# EAGLE design Pottery Wheel  V_1_1_9 (EAGLE 9.6.2)
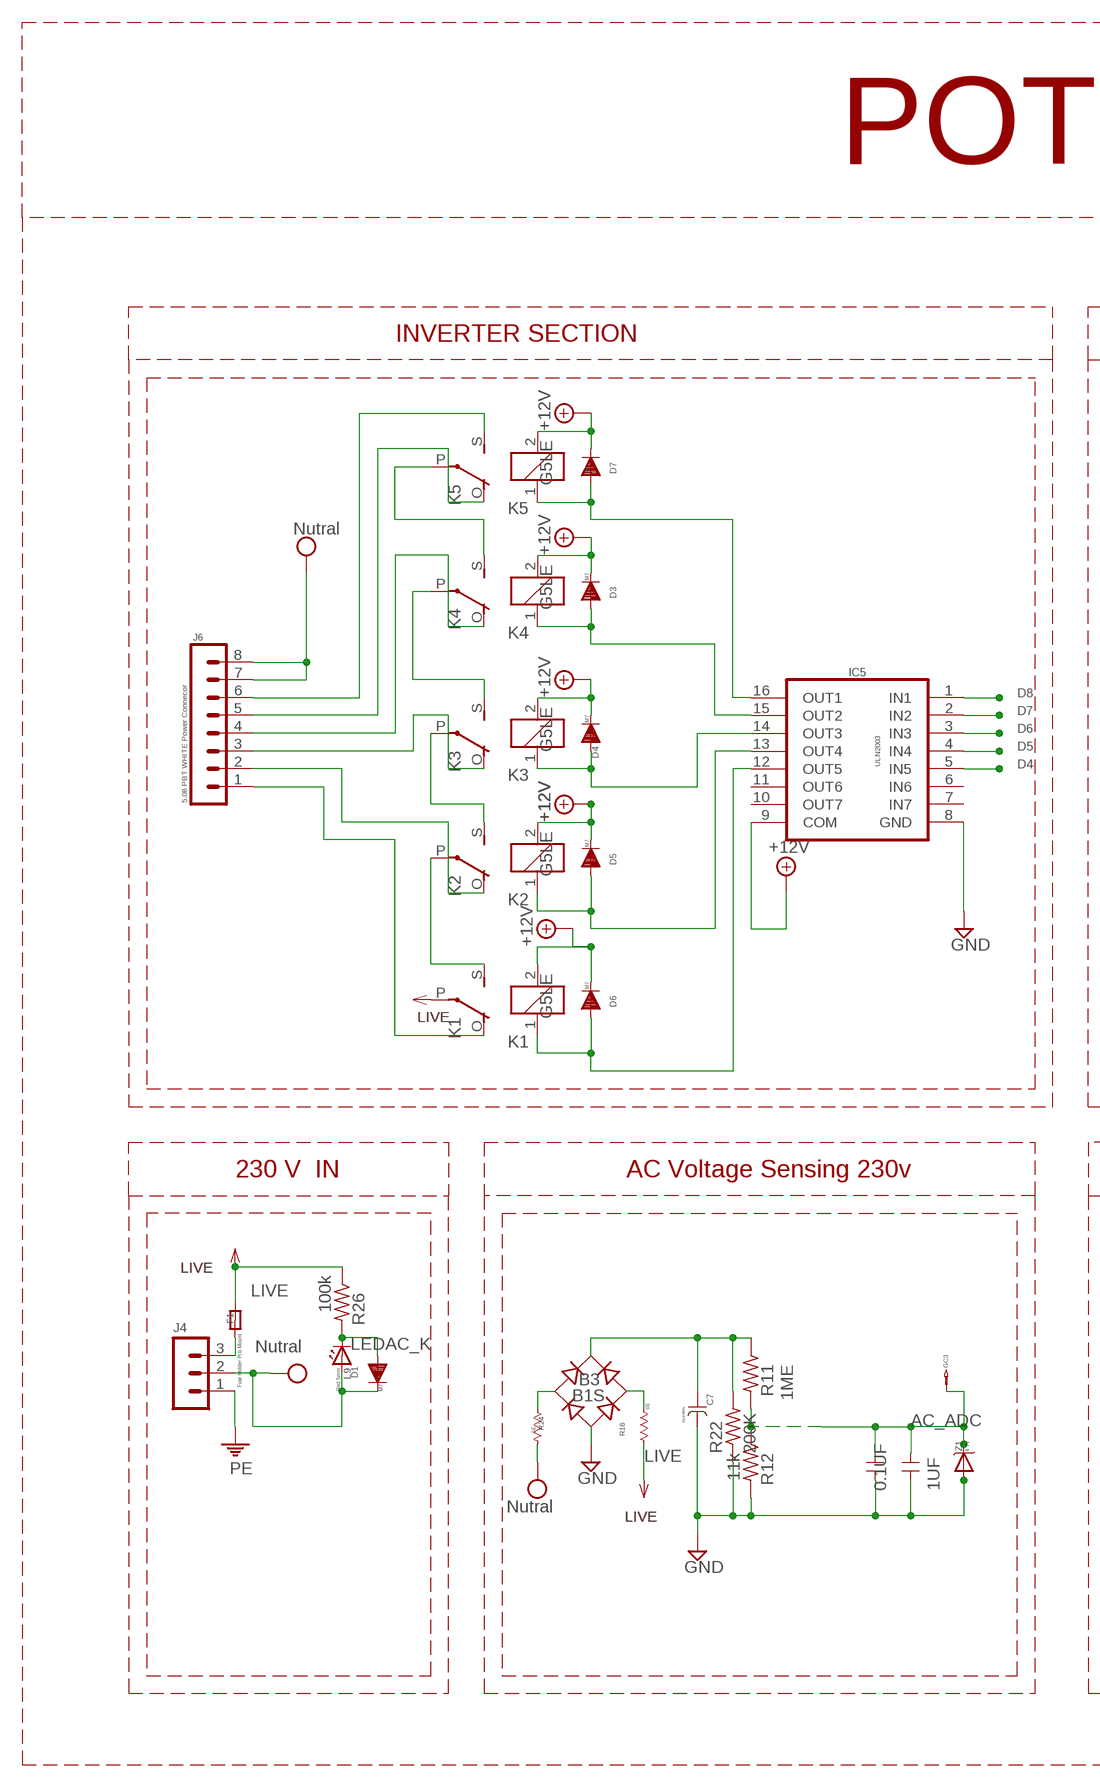
[diagram p0: schematic, sheet 1, part 1 of 2]
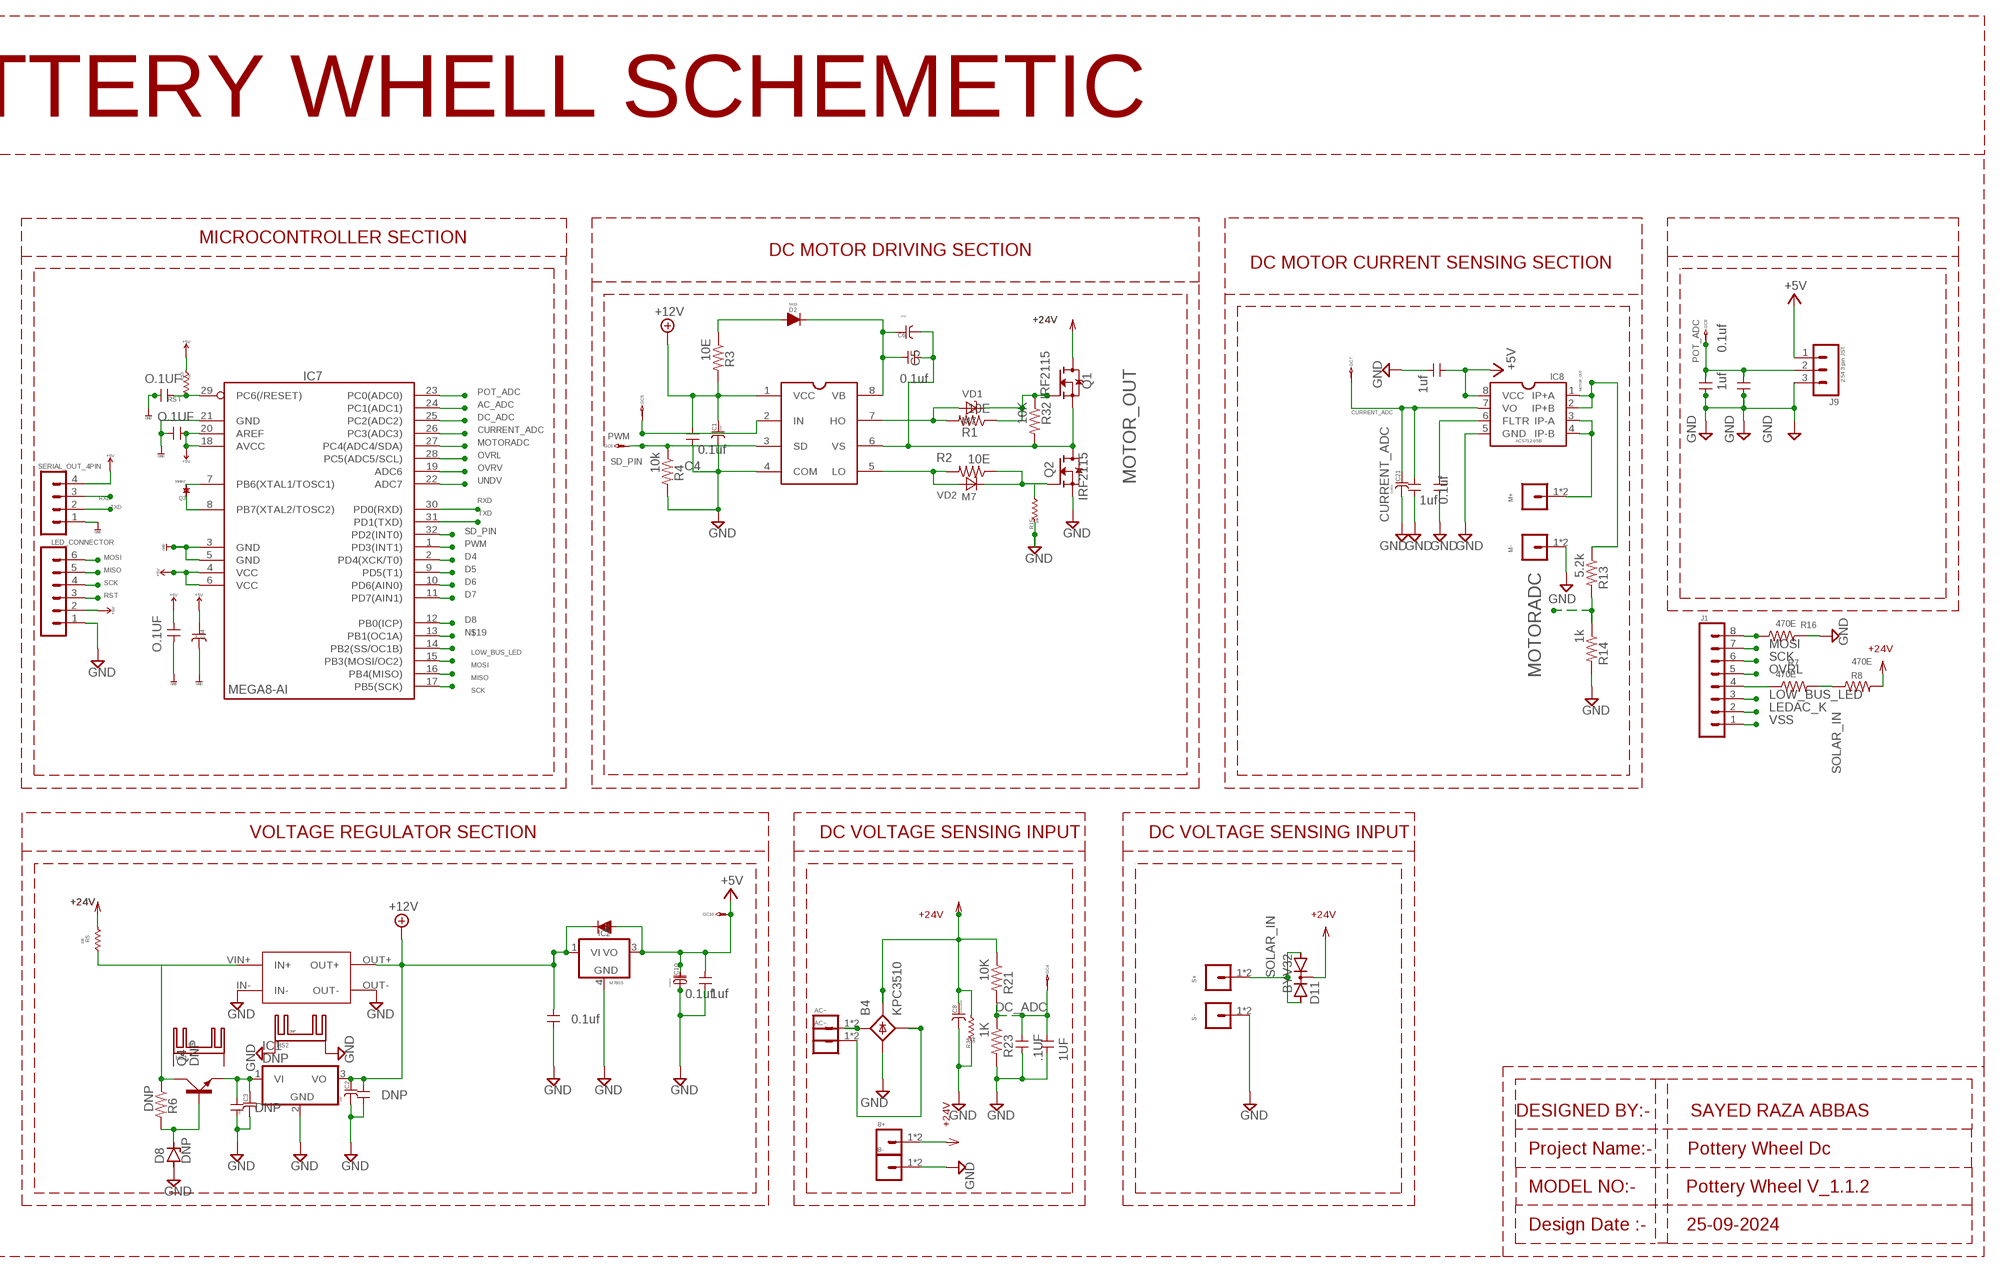
[diagram p1: schematic, sheet 1, part 2 of 2]

## Parts
AC~  JST_1-PINBARR  [1-PIN_9.6]
AC~.  JST_1-PINBARR  [1-PIN_9.6]
B3  B1S  [MBS]
B4  KPC3510  B25A-  [B25A-]
B+  JST_1-PINBARR  [1-PIN_9.6]
B-  JST_1-PINBARR  [1-PIN_9.6]
C1  10uf  CAP_ELE6_V  [C_6_V]
C2  DNP  CAP_ELE8_V  [C_8_V]
C3  DNP  CAP_ELE8_V  [C_8_V]
C4  0.1uf  C-USC1206  [C1206]
C5  0.1uf  C-USC1206  [C1206]
C6  10uf  CAP_ELE6_V  [C_6_V]
C7  10uf/450v  CAP_ELE8_V  [C_8_V]
C8  4700uf/50V  CAP_ELE19MM  [C_19MM]
C9  1uf  C-USC1206  [C1206]
C10  10uf/63v  CAP_ELE8_V  [C_8_V]
C11  DNP  C-USC1206  [C1206]
C12  DNP  C-USC1206  [C1206]
C13  0.1uf  C-USC1206  [C1206]
C15  0.1uf  C-USC1206  [C1206]
C16  1uf  C-USC1206  [C1206]
C17  0.1uf  C-USC1206  [C1206]
C18  1uf  C-USC1206  [C1206]
C20  1uf  C-USC1206  [C1206]
C21  10uf/63v  CAP_ELE5_V  [C_5_V]
C22  .1UF  C-USC1206  [C1206]
C23  1UF  C-USC1206  [C1206]
C24  0.1UF  C-USC1206  [C1206]
C25  1UF  C-USC1206  [C1206]
C28  O.1UF  C-USC1206  [C1206]
C29  O.1UF  C-USC1206  [C1206]
C30  O.1UF  C-USC1206  [C1206]
C34  DNP  CAP_TANTA  [TANT_1206]
C36  0.1uf  C-USC1206  [C1206]
D1  M7  DIODE  [SMB]
D2  5819  DIODE80  [SOD-80]
D3  M7  DIODE  [SMB]
D4  M7  DIODE  [SMB]
D5  M7  DIODE  [SMB]
D6  M7  DIODE  [SMB]
D7  M7  DIODE  [SMB]
D8  DNP  ZENER-DIODEZD-12.5  [ZDIO12.5]
D9  M7  DIODE  [SMB]
D11  BYV32  [TO220ABS]
F1  Fuse Holder Pcb Mount  FUSEBOX  [FH_BOX]
GC3  PTR1PAD1-17Y  [P1-17Y]
GC4  PTR1PAD1-17Y  [P1-17Y]
GC5  PTR1PAD1-17Y  [P1-17Y]
GC6  PTR1PAD1-17Y  [P1-17Y]
GC7  PTR1PAD1-17Y  [P1-17Y]
GC8  PTR1PAD1-17Y  [P1-17Y]
GC10  PTR1PAD1-17Y  [P1-17Y]
HS1  DNP  HEATSINKPI-49  [PI-49]
HS2  DNP  HEATSINKPI-49  [PI-49]
IC1  DNP  786TV  [TO220V]
IC2  M7805  78XXDPAK  [DPAK]
IC5  ULN2003  ULN2003SO  [SOIC-16]
IC7  MEGA8-AI  [TQFP32-08]
IC8  ACS712-05B  ACS712-20TSOIC  [SO-08]
J1  JST_8-PINM  [MOLEX_8-PIN]
J4  JST_3-PIN7.62  [3-PIN_7.62]
J6  5.08 PBT WHITE Power Connecor  JST_8-PIN5.08  [8-PIN_5.08_PWR]
J9  2.54 3 pin JST  JST_3-PINM  [MOLEX_3-PIN]
K1  G5LE  [G5LE]
K2  G5LE  [G5LE]
K3  G5LE  [G5LE]
K4  G5LE  [G5LE]
K5  G5LE  [G5LE]
L9  Red 5mm  LED5MM  [LED_5MM]
LED_CONNECTOR  JST_6-PINM  [MOLEX_6-PIN]
M+  JST_1-PINBARR  [1-PIN_9.6]
M-  JST_1-PINBARR  [1-PIN_9.6]
Q1  IRF2115  IRF5210  [TO254P1054X469X2933-3]
Q2  IRF2115  IRF5210  [TO254P1054X469X2933-3]
Q3  16MHZ  CRYSTALHC49S  [HC49/S]
Q4  DNP  TIP41C  [TO220AV]
R1  10E  R-US_M1206  [M1206]
R2  10E  R-US_M1206  [M1206]
R3  10E  R-US_M1206  [M1206]
R4  10k  R-US_M1206  [M1206]
R5  10E  RESISTOR2L  [RES_2W_L]
R6  DNP  R-US_M1206  [M1206]
R7  470E  R-US_M1206  [M1206]
R8  470E  R-US_M1206  [M1206]
R11  1ME  R-US_M1206  [M1206]
R12  11k  R-US_M1206  [M1206]
R13  5.2k  R-US_M1206  [M1206]
R14  1k  R-US_M1206  [M1206]
R15  10K  RESISTORM1  [1206]
R16  470E  R-US_M1206  [M1206]
R18  0E  RESISTOR2V  [2W]
R21  10K  R-US_M1206  [M1206]
R22  200K  R-US_R2512  [R2512]
R23  1K  R-US_M1206  [M1206]
R24  0E  RESISTOR2V  [2W]
R26  100k  R-US_M1206  [M1206]
R32  10K  R-US_M1206  [M1206]
R34  DNP  RESISTORM1  [1206]
R53  10K  RESISTORM  [0805]
S+  JST_1-PINBARR  [1-PIN_9.6]
S-  JST_1-PINBARR  [1-PIN_9.6]
SERIAL_OUT_4PIN  JST_4-PINM  [MOLEX_4-PIN]
U$1  IR2104S  [IR2104S]
U$3  XL7015  [XL7015]
VD1  M7  DIODE-TVS-UNIDIR-SMB  [SMB]
VD2  M7  DIODE-TVS-UNIDIR-SMB  [SMB]
Z1  4.7V  Z_DIODE  [SMB_Z]

## Nets
+5V: C10.+ C16.1 C17.1 C18.1 C28.2 C30.2 C34.+ D9.A GC10.TP IC2.3(VO) IC7.4(VCC) IC7.6(VCC) IC7.18(AVCC) IC7.20(AREF) IC8.8(VCC) J9.1 LED_CONNECTOR.2 R53.2 SERIAL_OUT_4PIN.4
+12V: C1.+ C2.+ C4.1 C11.1 C13.1 D3.K D4.K D5.K D6.K D7.K D9.K IC1.3(VO) IC2.1(VI) IC5.9(COM) K1.2 K2.2 K3.2 K4.2 K5.2 R3.2 U$1.1(VCC) U$3.OUT+
+24V: B4.+ B4.+1(+) B+.1 B+.2 C8.1(+) D11.C Q1.DRAIN R5.1 R8.2 R21.1 R34.2
AC_ADC: C24.1 C25.1 GC3.TP IC7.24(PC1(ADC1)) R11.2 R12.1 Z1.K
CURRENT_ADC: C20.1 C21.+ GC7.TP IC7.26(PC3(ADC3)) IC8.7(VO)
D4: IC5.5(IN5) IC7.2(PD4(XCK/T0))
D5: IC5.4(IN4) IC7.9(PD5(T1))
D6: IC5.3(IN3) IC7.10(PD6(AIN0))
D7: IC5.2(IN2) IC7.11(PD7(AIN1))
D8: IC5.1(IN1) IC7.12(PB0(ICP))
DC_ADC: C22.1 C23.1 GC4.TP IC7.25(PC2(ADC2)) R21.2 R23.1
GND: B3.- B4.- B4.-1(-) B-.1 B-.2 C1.- C2.- C3.- C4.2 C7.- C8.2(-) C9.2 C10.- C11.2 C12.2 C13.2 C15.2 C16.2 C17.2 C18.2 C20.2 C21.- C22.2 C23.2 C24.2 C25.2 C28.1 C29.1 C30.1 C34.- C36.2 D8.A HS2.1 HS2.2 IC1.2(GND) IC2.4(GND) IC5.8(GND) IC7.3(GND) IC7.5(GND) IC7.21(GND) IC8.5(GND) J9.3 LED_CONNECTOR.1 M-.1 M-.2 Q2.SOURCE R4.2 R12.2 R14.2 R15.1 R16.2 R22.1 R23.2 R34.1 S-.1 S-.2 SERIAL_OUT_4PIN.1 U$1.4(COM) U$3.IN- U$3.OUT- Z1.A
LEDAC_K: D1.A J1.2 L9.K R26.2
LIVE: F1.2 K1.P(2:P) R18.1 R26.1
LOW_BUS_LED: IC7.14(PB2(SS/OC1B)) J1.3
MISO: IC7.16(PB4(MISO)) LED_CONNECTOR.5
MOSI: IC7.15(PB3(MOSI/OC2)) J1.7 LED_CONNECTOR.6
MOTOR_OUT: C5.2 C6.- IC8.1(IP+A) IC8.2(IP+B) Q1.SOURCE Q2.DRAIN R13.1 R32.2 U$1.6(VS)
MOTORADC: IC7.27(PC4(ADC4/SDA)) R13.2 R14.1
N$1: R1.2 U$1.7(HO) VD1.A
N$2: R2.2 U$1.5(LO) VD2.A
N$3: Q2.GAET(GATE) R2.1 R15.2 VD2.C
N$4: Q4.C R5.2 R6.1 U$3.VIN+(IN+)
N$5: AC~.1 AC~.2 B4.AC1 B4.AC1-(AC1)
N$6: Q1.GAET(GATE) R1.1 R32.1 VD1.C
N$7: F1.1 J4.3
N$8: C5.1 C6.+ D2.K U$1.8(VB)
N$9: D2.A R3.1
N$10: C15.1 IC8.6(FLTR)
N$11: AC~..1 AC~..2 B4.AC2 B4.AC2-(AC2)
N$12: J6.1 K1.O(2:O)
N$13: K1.S(2:S) K2.P(2:P)
N$14: J6.2 K2.O(2:O)
N$15: K2.S(2:S) K3.P(2:P)
N$16: K3.S(2:S) K4.P(2:P)
N$17: J6.3 K3.O(2:O)
N$18: J6.4 K4.O(2:O)
N$19: IC7.13(PB1(OC1A))
N$20: D4.A IC5.14(OUT3) K3.1
N$21: C3.+ C12.1 IC1.1(VI) Q4.E
N$22: D6.A IC5.12(OUT5) K1.1
N$23: J1.4 R7.1
N$24: D8.C Q4.B R6.2
N$25: D5.A IC5.13(OUT4) K2.1
N$28: IC7.7(PB6(XTAL1/TOSC1)) Q3.2
N$29: K4.S(2:S) K5.P(2:P)
N$30: J6.5 K5.O(2:O)
N$31: J6.6 K5.S(2:S)
N$32: B3.AC1 R24.1
N$34: D3.A IC5.15(OUT2) K4.1
N$36: IC7.8(PB7(XTAL2/TOSC2)) Q3.1
N$37: D7.A IC5.16(OUT1) K5.1
N$38: B3.AC2 R18.2
N$40: B3.+ C7.+ R11.1 R22.2
N$47: IC8.3(IP-A) IC8.4(IP-B) M+.1 M+.2
N$50: J1.8 R16.1
OVRL: IC7.28(PC5(ADC5/SCL)) J1.5
OVRV: IC7.19(ADC6)
PE: J4.1
POT_ADC: C9.1 C36.1 GC8.TP IC7.23(PC0(ADC0)) J9.2
PWM: GC5.TP IC7.1(PD3(INT1)) U$1.2(IN)
RST: C29.2 IC7.29(PC6(/RESET)) LED_CONNECTOR.3 R53.1
RXD: IC7.30(PD0(RXD)) SERIAL_OUT_4PIN.3
SCK: IC7.17(PB5(SCK)) J1.6 LED_CONNECTOR.4
SD_PIN: GC6.TP IC7.32(PD2(INT0)) R4.1 U$1.3(SD)
SOLAR_IN: D11.A1 D11.A2 R7.2 R8.1 S+.1 S+.2
TXD: IC7.31(PD1(TXD)) SERIAL_OUT_4PIN.2
UNDV: IC7.22(ADC7)
VSS: D1.K J1.1 J4.2 J6.7 J6.8 L9.A R24.2 ; supply symbol labelled Nutral
Unconnected: HS1.1 HS1.2 IC5.6(IN6) IC5.7(IN7) IC5.10(OUT7) IC5.11(OUT6)

## Notes on the sheet
- POTTERY WHELL SCHEMETIC
- INVERTER SECTION | MICROCONTROLLER SECTION
- DC MOTOR DRIVING SECTION
- DC MOTOR CURRENT SENSING SECTION
- 230 V  IN | AC Voltage Sensing 230v | VOLTAGE REGULATOR SECTION | DC VOLTAGE SENSING INPUT | DC VOLTAGE SENSING INPUT
- DESIGNED BY:-        SAYED RAZA ABBAS
- Project Name:-       Pottery Wheel Dc
- MODEL NO:-          Pottery Wheel V_1.1.2
- Design Date :-        25-09-2024

## Library data of the parts
AC~ AC~. B+ B- M+ M- S+ S- = Squadron:JST_1-PIN
B3 = rectifier:B*S: Surface Mount Glass Passivated Bridge Rectifiers Source: Comchip Bridge Rectifiers B05S-G_B10S-G.pdf
B4 = rectifier:B25A-: RECTIFIER 25-A bridge
C1-C3 C6-C8 C10 C21 = Squadron:CAP_ELE
C4 C5 C9 C11-C13 C15-C18 C20 C22-C25 C28-C30 C36 = rcl:C-US: CAPACITOR, American symbol; SPICEPREFIX: C
C34 = Squadron:CAP_TANT
D1-D7 D9 = Squadron:DIODE
D8 = diode:ZENER-DIODE: Z-Diode
D11 = diode:BYV32: DIODE 2 x Si diode 200 V, 20 A/230 Apeak, 25 ns
F1 = Squadron:FUSE
GC3-GC8 GC10 = testpad:PTR1: TEST PIN
HS1 HS2 = Squadron:HEATSINK
IC1 = linear:78*: Positive VOLTAGE REGULATOR Source: http://cache.national.com/ds/LM/LM78L05.pdf http://www.fairchildsemi.com/ds/LM/LM7805.pdf
IC2 = Squadron:78XX
IC5 = Squadron:ULN2003
IC7 = atmel:MEGA8: MICROCONTROLLER 8 Kbytes FLASH, 1 kbytes SRAM, 512 bytes EEPROM, USART, 6-channel 10 bit ADC, 2-channel 8 bit ADC Pin compatible with Atmega48, ATMega88, ATMega168 Source: avr.lbr; MPN: ATMEGA8-16AU; OC_FARNELL: 9171371; OC_NEWARK: 73M8863
IC8 = R_Sol:ACS712-20T
J1 J6 = Squadron:JST_8-PIN
J4 J9 = Squadron:JST_3-PIN
K1-K5 = relay:G5LE: RELAY 1 x switch, 10 A/120 V AC, 8 A/30 V DC, Omron
L9 = Squadron:LED
LED_CONNECTOR = Squadron:JST_6-PIN
Q1 Q2 = IRFB4110:IRF5210: Check availability <https://pricing.snapeda.com/parts/IRF5210/Infineon%20Technologies/view-part?ref=eda>; AVAILABILITY: In Stock; CHECK_PRICES: https://www.snapeda.com/parts/IRF5210/Infineon+Technologies/view-part/?ref=eda; DESCRIPTION: P-Channel 100 V 38A (Tc) 3.1W (Ta), 170W (Tc) Through Hole TO-262; MF: Infineon Technologies; MP: IRF5210; PACKAGE: TO-220 Infineon; PRICE: None; SNAPEDA_LINK: https://www.snapeda.com/parts/IRF5210/Infineon+Technologies/view-part/?ref=snap
Q3 = crystal:CRYSTAL: CRYSTAL; OC_FARNELL: 1667008; OC_NEWARK: unknown
Q4 = transistor-power:TIP41C: NPN TRANSISTOR
R1-R4 R6-R8 R11-R14 R16 R21-R23 R26 R32 = rcl:R-US_: RESISTOR, American symbol; SPICEPREFIX: R
R5 R15 R18 R24 R34 R53 = Squadron:RESISTOR
SERIAL_OUT_4PIN = Squadron:JST_4-PIN
U$1 = IR2104S:IR2104S: Half Bridge Mosfet - IGBT driver SOIC Check availability <https://pricing.snapeda.com/parts/IR2104S/Infineon%20Technologies/view-part?ref=eda>; AVAILABILITY: In Stock; CHECK_PRICES: https://www.snapeda.com/parts/IR2104S/Infineon+Technologies/view-part/?ref=eda; DESCRIPTION: Half-Bridge Gate Driver IC Non-Inverting 8-SOIC; MF: Infineon Technologies; MP: IR2104S; PACKAGE: SO-8 Infineon; PRICE: None; PURCHASE-URL: https://www.snapeda.com/api/url_track_click_mouser/?unipart_id=582439&manufacturer=Infineon Technologies&part_name=IR2104S&search_term=None; SNAPEDA_LINK: https://www.snapeda.com/parts/IR2104S/Infineon+Technologies/view-part/?ref=snap
U$3 = Squadron:XL7015
VD1 VD2 = diode:DIODE-TVS-UNIDIR-
Z1 = Squadron:Z_DIODE

## Board
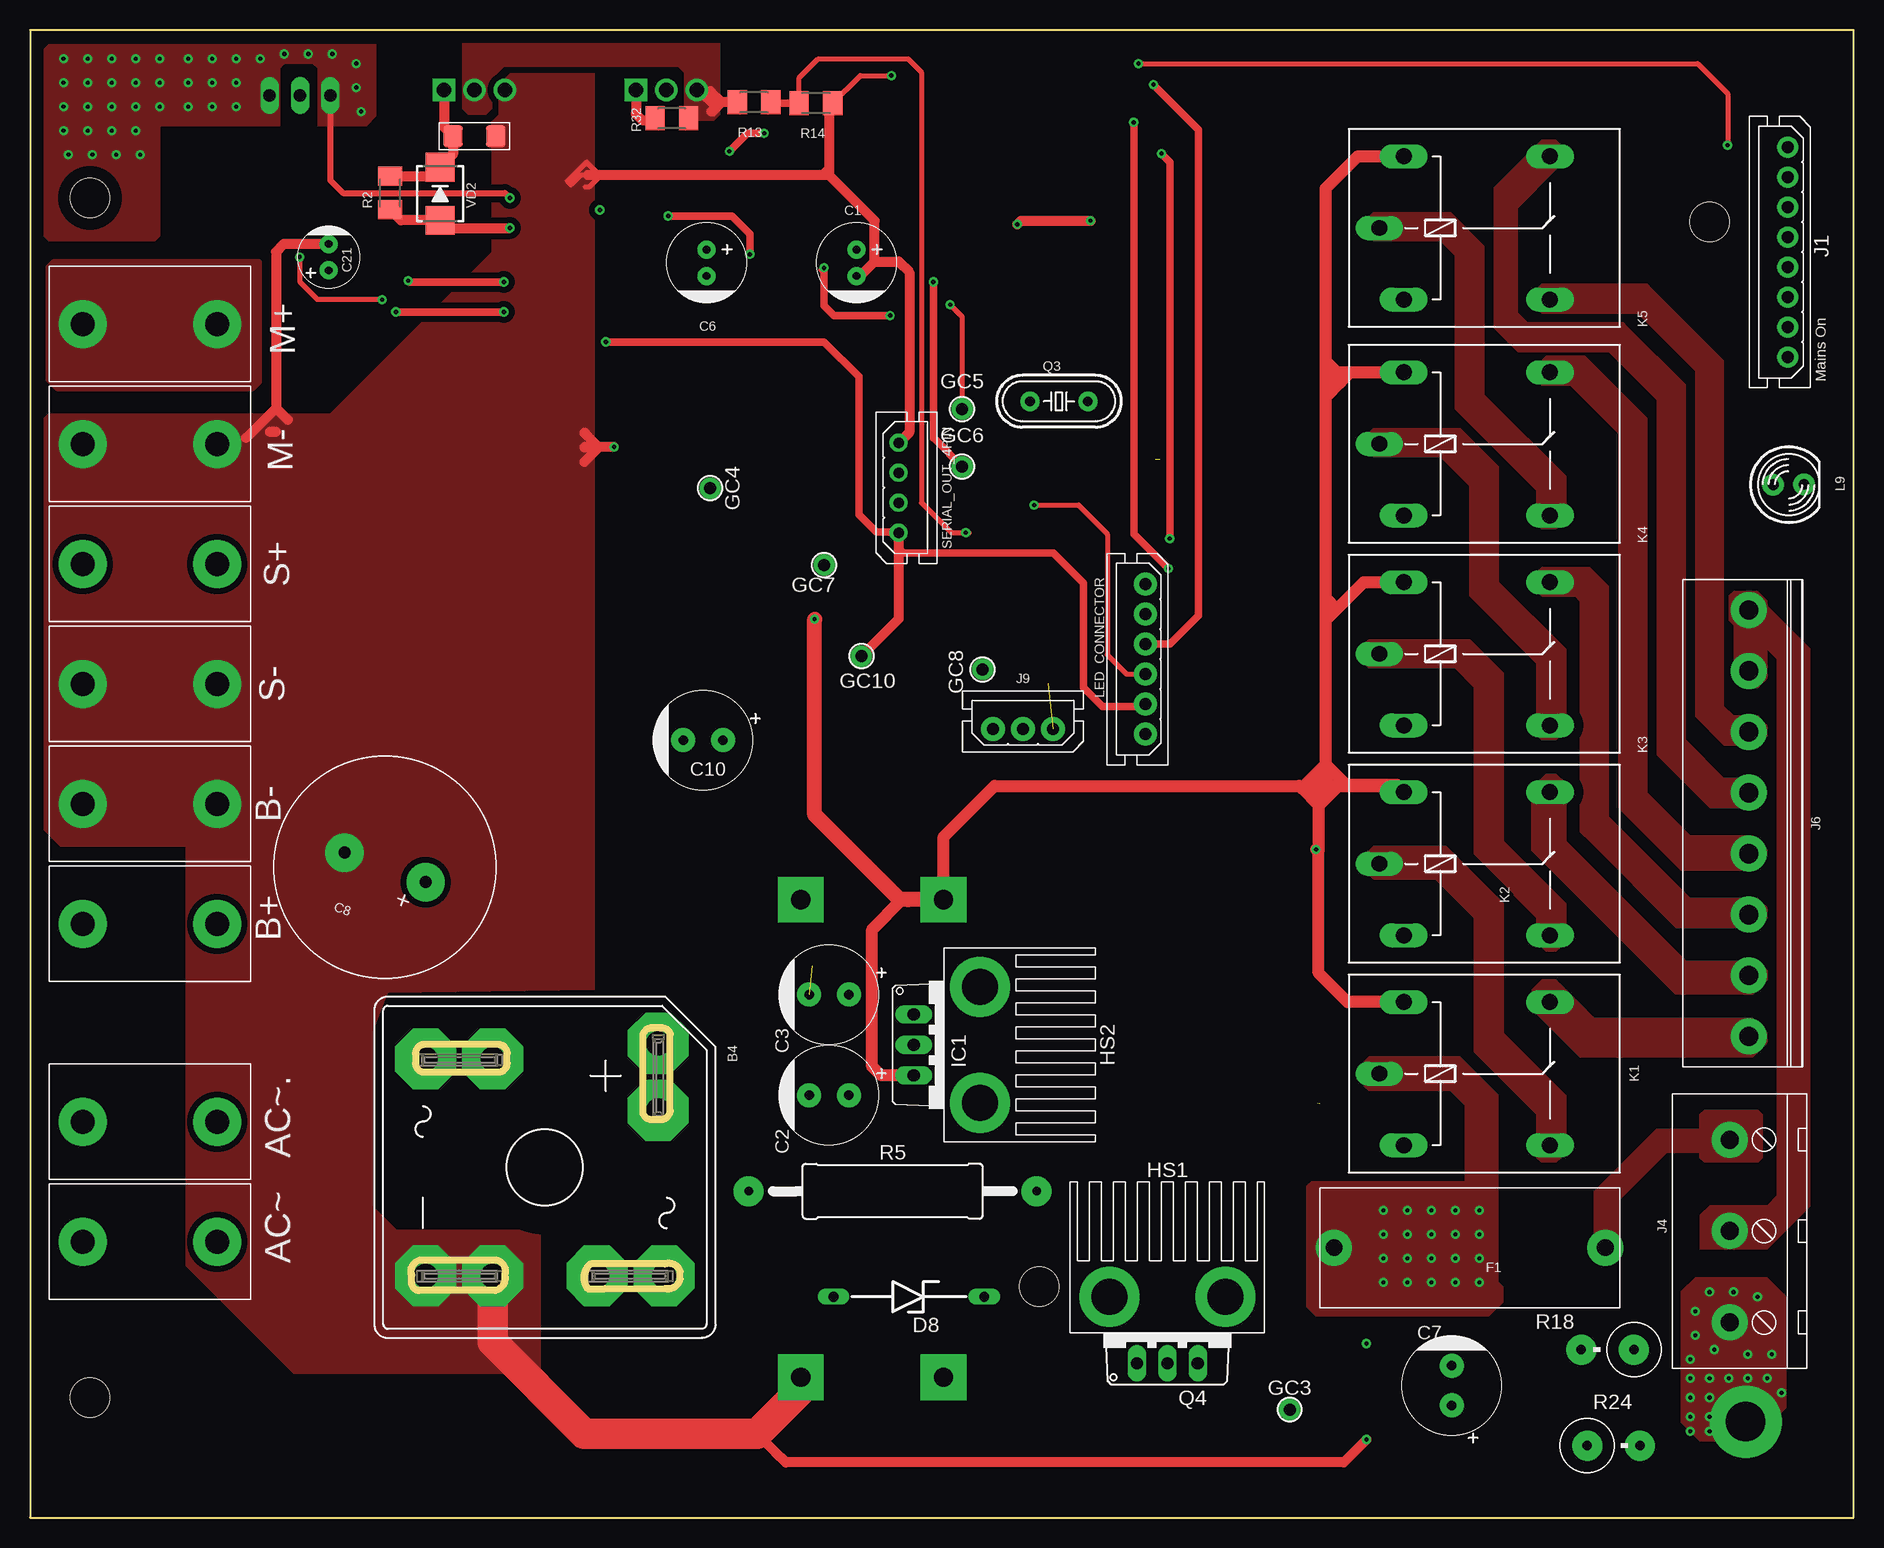
[diagram p2: board, top side]
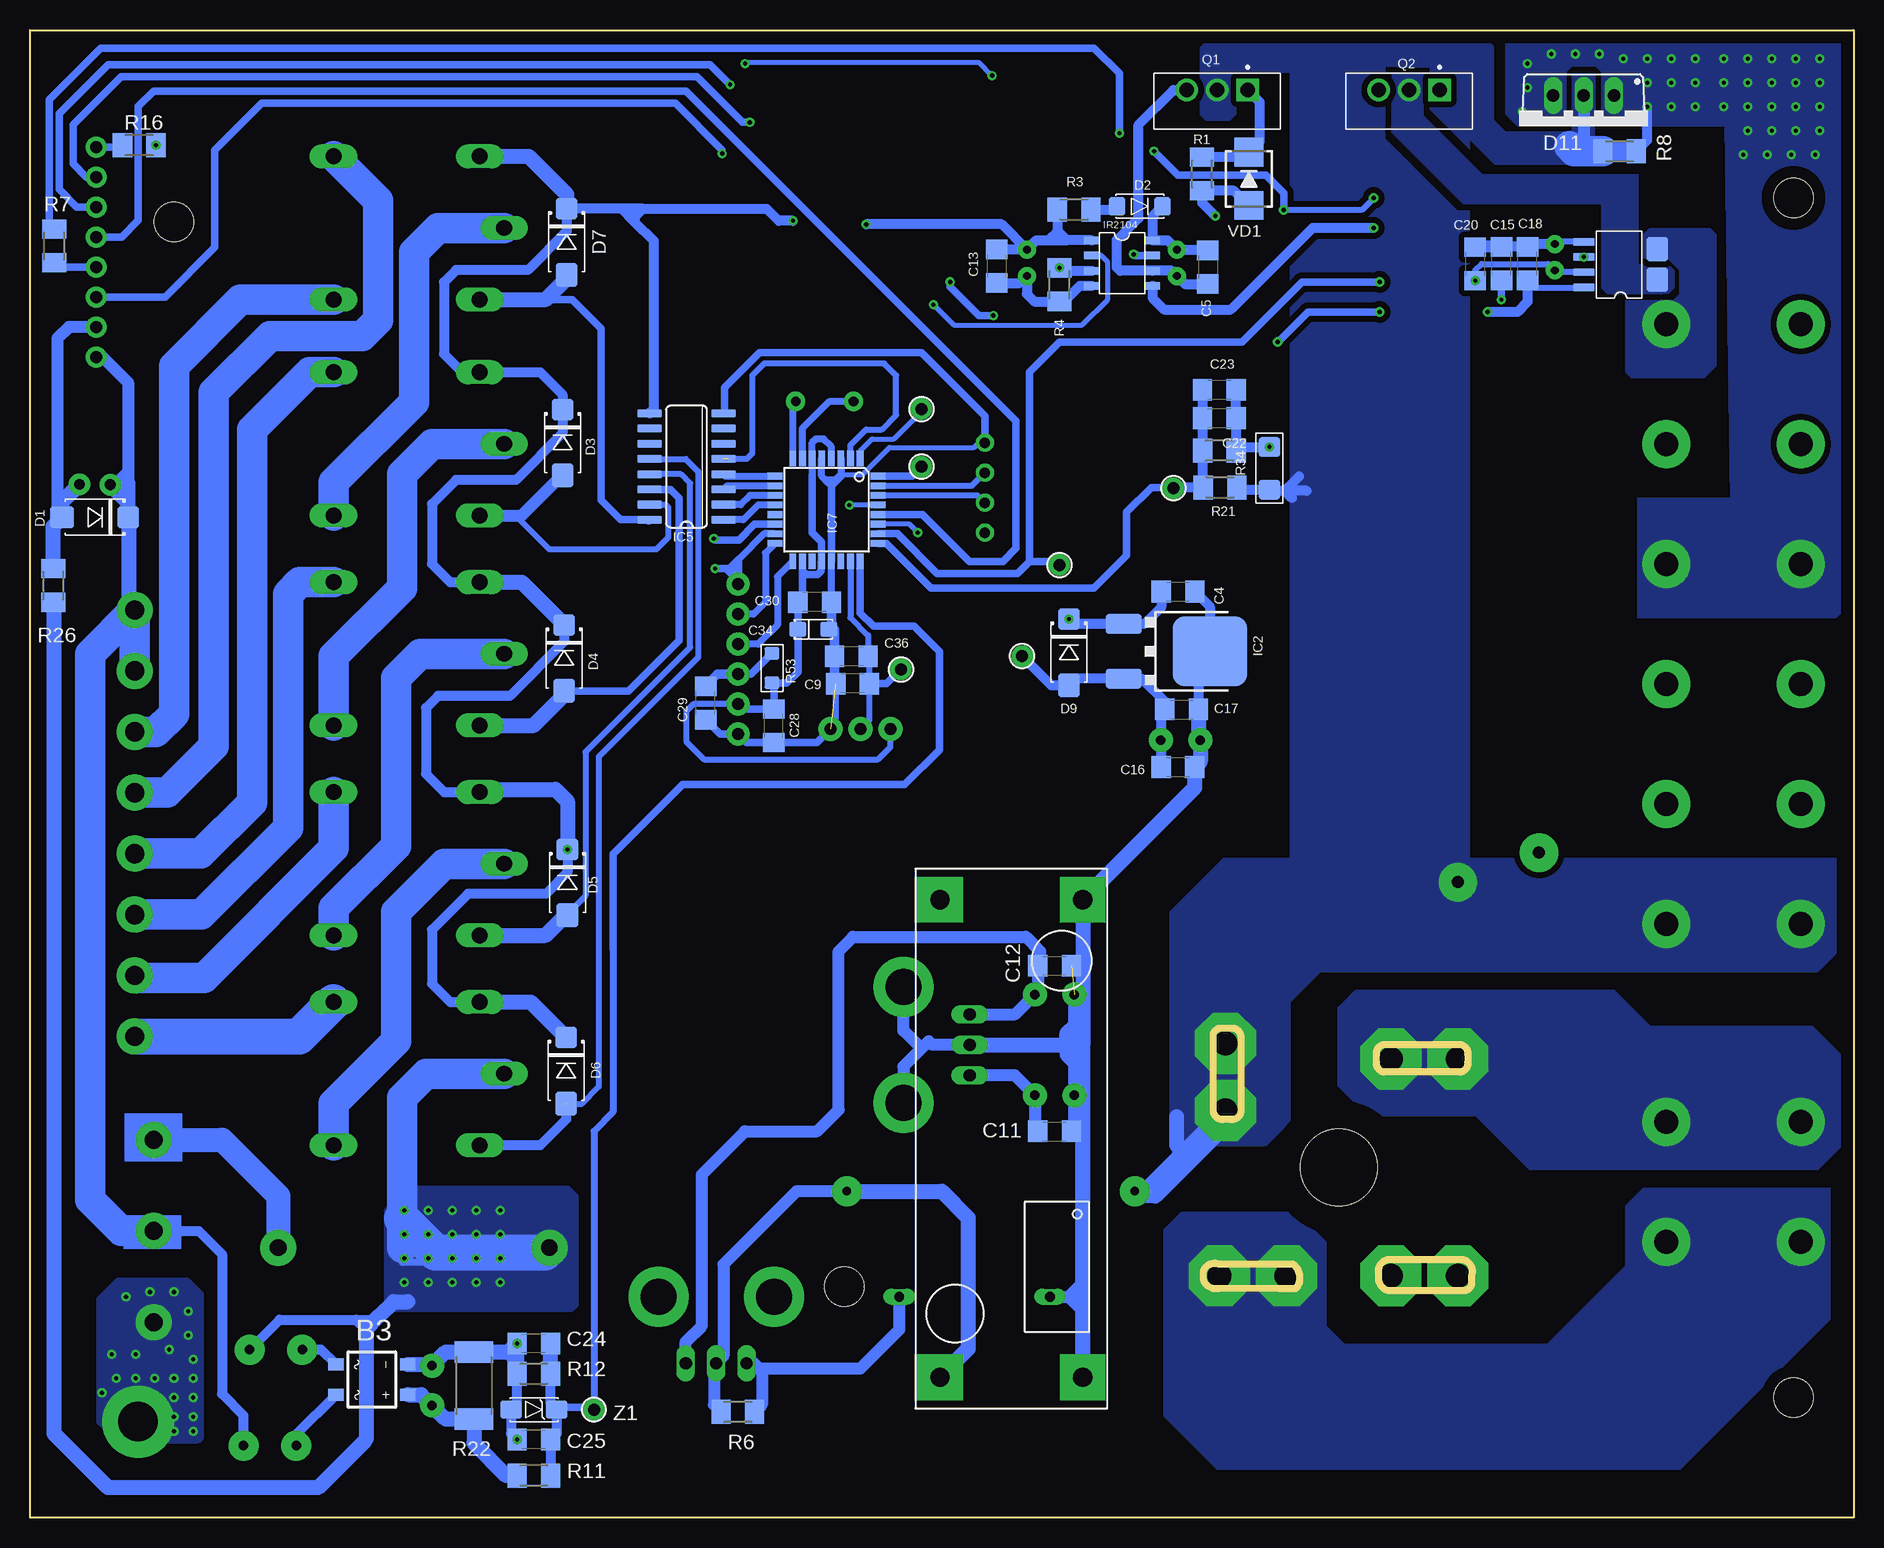
[diagram p3: board, bottom side, seen from below]

Size 152 x 124 mm. Coordinates in mm from the lower left corner, seen from the top.
Outline: 152,124 0,124 0,0 152,0 152,124
Copper layers (1*16): Top 0.035mm / dielectric 1.5mm / Bottom 0.035mm
Design rules "default *": minimum track width 6mil, minimum drill 0.35mm, track to track 6mil, track to pad 6mil, pad to pad 6mil, via to via 6mil, smd to smd 6mil, copper to edge 40mil, drill to drill 6mil, minimum pad ring 10mil, minimum via ring 8mil, stop-mask expansion 4mil, vias tented up to drill 0mil, thermal gap 10mil
Holes 3.3 mm at 84.12,19.25 5,10 5,110 140,108
Milling: 30 lines

### Footprints (pad centres in the part's own frame; a part is rotated, then mirrored left to right if it is on the bottom)
1-PIN_9.6 = drill 2 pad 4: 1 0,5.6; 2 0,-5.6
MBS = smd 1 x 1.3: + -1.27,-3; - 1.27,-3; AC1 -1.27,3; AC2 1.27,3
B25A- = drill 2.007 pad 5.08 octagon: + -10.338,9.449; +1 -4.75,9.449; - 9.042,-4.343; -1 9.042,-9.931; AC1 9.042,4.343; AC1- 9.042,9.931; AC2 -9.042,-4.343; AC2- -9.042,-9.931 | hole 6.401: 0,0
C_6_V = drill 0.65 pad 1.5: + -1.1,0; - 1.1,0
C_8_V = drill 0.8 pad 2: + -1.65,0; - 1.65,0
C1206 = smd 1.6 x 1.8: 1 -1.4,0; 2 1.4,0
C_19MM = drill 1 pad 3.2: 1 -3.6,0; 2 3.6,0
C_5_V = drill 0.65 pad 1.5: + -1.1,0; - 1.1,0
TANT_1206 = smd 1.4 x 1.2: + -1.3,0; - 1.3,0
SMB = smd 2 x 1.8: A 2.75,0 | smd 1.8 x 1.8: K -2.75,0
SOD-80 = smd 1.4 x 1.5: A -1.9,0; K 1.9,0
ZDIO12.5 = drill 0.813 long: A 6.223,0; C -6.35,0
TO220ABS = drill 1.016 long: A1 -2.54,-2.54; A2 2.54,-2.54; C 0,-2.54
FH_BOX = drill 1.4 pad 3: 1 -11.3,0; 2 11.3,0
P1-17Y = drill 1 pad 1.8: TP 0,0
PI-49 = drill 3 pad 5: 1 -4.825,3; 2 4.825,3
TO220V = drill 1.016 long: 1 -2.54,-2.54; 2 0,-2.54; 3 2.54,-2.54
DPAK = smd 1.6 x 3: 1 -2.28,-6.07; 3 2.28,-6.07 | smd 5.8 x 6.2: 4 0,1.11
SOIC-16 = smd 0.66 x 2.032: 1 -4.445,-3.073; 2 -3.175,-3.073; 3 -1.905,-3.073; 4 -0.635,-3.073; 5 0.635,-3.073; 6 1.905,-3.073; 7 3.175,-3.073; 8 4.445,-3.073; 9 4.445,3.073; 10 3.175,3.073; 11 1.905,3.073; 12 0.635,3.073; 13 -0.635,3.073; 14 -1.905,3.073; 15 -3.175,3.073; 16 -4.445,3.073
TQFP32-08 = smd 1.27 x 0.559: 1 -4.293,2.8; 2 -4.293,2; 3 -4.293,1.2; 4 -4.293,0.4; 5 -4.293,-0.4; 6 -4.293,-1.2; 7 -4.293,-2; 8 -4.293,-2.8; 17 4.293,-2.8; 18 4.293,-2; 19 4.293,-1.2; 20 4.293,-0.4; 21 4.293,0.4; 22 4.293,1.2; 23 4.293,2; 24 4.293,2.8 | smd 0.559 x 1.27: 9 -2.8,-4.293; 10 -2,-4.293; 11 -1.2,-4.293; 12 -0.4,-4.293; 13 0.4,-4.293; 14 1.2,-4.293; 15 2,-4.293; 16 2.8,-4.293; 25 2.8,4.293; 26 2,4.293; 27 1.2,4.293; 28 0.4,4.293; 29 -0.4,4.293; 30 -1.2,4.293; 31 -2,4.293; 32 -2.8,4.293
SO-08 = smd 2.032 x 1.778: 1 -1.27,-3.073; 3 1.27,-3.073 | smd 0.254 x 0.254: 2 -1.651,-3.073; 4 1.651,-3.073 | smd 0.635 x 1.778: 5 1.905,3.073; 6 0.635,3.073; 7 -0.635,3.073; 8 -1.905,3.073
MOLEX_8-PIN = drill 1 pad 1.75: 1 8.75,0; 2 6.25,0; 3 3.75,0; 4 1.25,0; 5 -1.25,0; 6 -3.75,0; 7 -6.25,0; 8 -8.75,0
3-PIN_7.62 = drill 1.5 pad 3: 1 -7.62,0; 2 0,0; 3 7.62,0
8-PIN_5.08_PWR = drill 1.6 pad 3: 1 17.78,5.5; 2 12.7,5.5; 3 7.62,5.5; 4 2.54,5.5; 5 -2.54,5.5; 6 -7.62,5.5; 7 -12.7,5.5; 8 -17.78,5.5
MOLEX_3-PIN = drill 1 pad 2: 1 2.5,0; 2 0,0; 3 -2.5,0
G5LE = drill 1.321 long: 1 -7.493,-5.969; 2 -7.493,5.969; O 4.699,5.969; P -9.525,0; S 4.699,-5.969
LED_5MM = drill 0.9 pad 1.8: A 0,-1.295; K -0.025,1.27
MOLEX_6-PIN = drill 1 pad 1.93: 1 6.25,0; 2 3.75,0; 3 1.25,0; 4 -1.25,0; 5 -3.75,0; 6 -6.25,0
TO254P1054X469X2933-3 = drill 1.23 pad 1.85: DRAIN 2.54,0; SOURCE 5.08,0 | drill 1.23 pad 1.85 square: GAET 0,0
HC49/S = drill 0.8 pad 1.6: 1 -2.413,0; 2 2.413,0
TO220AV = drill 1.016 long: B -2.54,-2.54; C 0,-2.54; E 2.54,-2.54
M1206 = smd 1.6 x 2: 1 -1.4,0; 2 1.4,0
RES_2W_L = drill 0.7 pad 2.5: 1 -12,0; 2 12,0
1206 = smd 1.6 x 1.8: 1 -1.781,0; 2 1.781,0
2W = drill 0.8 pad 2.5: 1 -2.2,0; 2 2.2,0
R2512 = smd 1.8 x 3.2: 1 -2.8,0; 2 2.8,0
0805 = smd 1.016 x 1.25: 1 -1.231,0; 2 1.231,0
MOLEX_4-PIN = drill 0.9 pad 1.5: 1 3.75,0; 2 1.25,0; 3 -1.25,0; 4 -3.75,0
IR2104S = smd 1.27 x 0.635: 1 0,3.81; 2 0,2.54; 3 0,1.27; 4 0,0; 5 5.08,0; 6 5.08,1.27; 7 5.08,2.54; 8 5.08,3.81
XL7015 = drill 1.6 pad 3.81 square: IN- -19.905,-5.95; OUT+ 19.905,5.95; OUT- 19.905,-5.95; VIN+ -19.905,5.95
SMB' = smd 2.4 x 2.4: A 2.223,0; C -2.223,0
SMB_Z = smd 1.8 x 1.5: A -1.9,0; K 1.9,0

### Placement (x,y rotation side)
AC~  10,23 270 top
AC~.  10,33 270 top
B3  123.5,11.5 90 bottom
B4  42.91,29.19 270 top
B+  10,49.5 270 top
B-  10,59.5 270 top
C1  68.9,104.6 270 top
C2  66.6,35.2 180 top
C3  66.6,43.6 180 top
C4  56.3,77.19 0 bottom
C5  53.82,104.23 270 bottom
C6  56.4,104.6 270 top
C7  118.5,11 90 top
C8  29.6,54.2 160 top
C9  83.44,69.51 180 bottom
C10  56.1,64.8 180 top
C11  66.6,32.2 0 bottom
C12  66.6,46 0 bottom
C13  71.42,104.31 270 bottom
C15  29.35,104.52 90 bottom
C16  56.31,62.56 0 bottom
C17  56.01,67.36 0 bottom
C18  27.17,104.52 90 bottom
C20  31.53,104.5 90 bottom
C21  24.91,105.06 90 top
C22  52.87,91.65 0 bottom
C23  52.87,94.01 0 bottom
C24  110,14.5 180 bottom
C25  110,6.5 180 bottom
C28  90,66 90 bottom
C29  95.67,67.9 90 bottom
C30  86.6,76.3 180 bottom
C34  86.7,74.04 0 bottom
C36  83.54,71.79 180 bottom
D1  146.56,83.38 180 bottom
D2  59.5,109.3 0 bottom
D3  107.61,89.61 270 bottom
D4  107.47,71.66 270 bottom
D5  107.2,52.94 270 bottom
D6  107.31,37.26 270 bottom
D7  107.26,106.34 270 bottom
D8  73.2,18.4 180 top
D9  65.4,72.14 270 bottom
D11  22.5,116 180 bottom
F1  120,22.5 180 top
GC3  105,9 0 top
GC4  56.7,85.8 270 top
GC5  77.7,92.4 0 top
GC6  77.7,87.6 0 top
GC7  66.2,79.4 0 top
GC8  79.4,70.7 0 top
GC10  69.3,71.8 270 top
HS1  94.8,15.4 0 top
HS2  76.2,39.4 270 top
IC1  76.2,39.4 270 top
IC2  54.77,72.22 270 bottom
IC5  97.27,87.61 90 bottom
IC7  85.61,84.01 270 bottom
IC8  19.42,104.44 90 bottom
J1  146.5,105.5 270 top
J4  141.7,23.88 90 top
J6  137.78,57.88 270 top
J9  82.77,65.72 180 top
K1  122,37 0 top
K2  122,54.5 0 top
K3  122,72 0 top
K4  122,89.5 0 top
K5  122,107.5 0 top
L9  146.6,86.1 270 top
LED_CONNECTOR  92.97,71.55 270 top
M+  10,99.5 270 top
M-  10,89.5 270 top
Q1  50.5,119 180 bottom
Q2  34.5,119 180 bottom
Q3  85.77,93.05 180 top
Q4  94.8,15.4 0 top
R1  54.3,112 270 bottom
R2  30.01,110.42 270 top
R3  64.97,109.04 180 bottom
R4  66.19,102.78 270 bottom
R5  71.9,27.2 0 top
R6  93,8.8 0 bottom
R7  150,106 90 bottom
R8  19.5,113.9 180 bottom
R11  110,3.5 0 bottom
R12  110,12 180 bottom
R13  60.35,117.96 0 top
R14  65.51,117.9 0 top
R15  37.04,115.14 180 top
R16  142.9,114.4 0 bottom
R18  131.5,14 180 top
R21  52.8,85.88 180 bottom
R22  115,11 270 bottom
R23  52.85,88.93 0 bottom
R24  132,6 0 top
R26  150.07,77.69 90 bottom
R32  53.5,116.63 0 top
R34  48.69,87.47 270 bottom
R53  90.16,70.81 270 bottom
S+  10,79.5 90 top
S-  10,69.5 90 top
SERIAL_OUT_4PIN  72.42,85.84 90 top
U$1  63.51,102.66 0 bottom
U$3  70.2,31.6 90 bottom
VD1  M7  [SMB']  50.4,111.59 270 bottom
VD2  M7  [SMB']  34.19,110.35 270 top
Z1  110,9 0 bottom

### Tracks (layer width: path | path; a pad name or v marks a point on that pad's centre or on a via)
+5V  (via drill 0.35)
  Top 0.61: v30.5,100.5 v39.5,100.5 | v48,98 66.2,98 69.1,95.1 69.1,83.6 70.55,82.15 72.35,82.15 SERIAL_OUT_4PIN.4 | 72.42,80.79 72.81,80.4 85.3,80.4 87.8,77.9 87.8,69.2 89.4,67.6 92.77,67.6 LED_CONNECTOR.2
  Top 0.813: SERIAL_OUT_4PIN.4 72.42,74.92 GC10.TP
  Bottom 0.152: C28.2 90.38,67.3
  Bottom 0.508: 89.7,67.7 C28.2 | LED_CONNECTOR.2 96.7,67.8 97.3,67.2 97.3,64.7 95.8,63.2 81.3,63.2 80.27,64.23 J9.1 | IC8.8 22.53,102.5 26.55,102.5 C18.1
  Bottom 0.6: 87.68,73.72 C34.+ | 86.81,86.89 IC7.6 86.81,89.59 86.5,89.9 85.85,89.9 85.21,89.25 IC7.4
  Bottom 0.61: LED_CONNECTOR.2 92.57,67.4 C28.2 90,69.42 R53.2 88.92,69.58 88,70.5 C34.+ C30.2 87.61,76.69 87.61,78.7 | 87.61,78.7 IC7.18 | 87.61,78.7 87.35,78.7 87.28,78.62 86.34,78.62 86.07,78.89 86.07,79.65 IC7.20 86.01,81.31 86.81,82.11 86.81,86.89 | v39.5,100.5 45.5,100.5 v48,98
  Bottom 0.813: C18.1 27.17,101.33 28,100.5 v30.5,100.5 | C16.1 57.75,62.6 C10.+ 57.75,67.02 C17.1 57.41,68.01 59.34,69.94 IC2.3 64.86,69.94 D9.A 66.89,69.39 GC10.TP
+12V  (via drill 0.35)
  Top 0.813: v82.3,107.8 82.6,108.1 v88.4,108.1 | 107.4,60 107.4,61 | 107.4,60 107.4,59.4 107.6,59.4 109.2,61 | 107.4,60 108.4,61
  Top 1.016: U$3.OUT+ 76.15,56.75 80.4,61 105.8,61 | 107.4,55.6 107.4,59.4 106,60.8 | 107.4,55.6 107.3,55.6 D5.K | 105.8,61 106,60.8 | 105.8,61 106.2,61 | 106.8,61 106.2,61 | 106.8,61 107.4,61 | 107.4,61 108.4,61 109.2,61 113.98,61 K2.2 113.91,61.07 109.73,61.07 108.3,62.5 | 106.2,61 106,60.8 | 108.3,62.5 108,62.8 | 108,62.8 108,74.8 | 108.9,75.7 111.17,77.97 K3.2 | 108.9,75.7 108,74.8 | 107.4,61 108.3,61.9 108.3,62.5 | 106.8,61 108.3,62.5 | 106.2,61 108,62.8 | K1.2 109.83,42.97 107.4,45.4 107.4,55.6 | 108,74.8 108,76.6 | 108,76.6 108,93.4 | 110.07,95.47 K4.2 | 108,93.4 109.2,94.6 | 109.2,94.6 110.07,95.47 | 108,76.6 108.9,75.7 | 108,93.4 108,95.8 | 108,96.4 108,110.8 110.67,113.47 K5.2 | 109.2,94.6 108,95.8 | 108,95.8 108,96.4 | 108,96.4 108.93,95.47 110.07,95.47 | IC1.3 70.94,36.86 70.2,37.6 70.2,49 72.7,51.51 73.2,51.51
  Top 1.27: U$3.OUT+ 73.2,51.51 72.5,51.51 65.4,58.6 D9.K
  Bottom 0.8: D6.K 107.68,40.38
  Bottom 0.813: D7.K 107.26,107.24 110.5,104 116.5,104 117.5,103 117.5,97 115.97,95.47 K4.2 109.47,95.47 107.61,93.61 D3.K 107.61,90.39 111.5,86.5 116.5,86.5 118.5,84.5 118.5,79.5 116.97,77.97 K3.2 | D4.K 107.47,73.03 112,68.5 118,68.5 119,67.5 119,62 117.47,60.47 K2.2 | D5.K 107.2,53.8 109,52 115.5,52 118.5,49 118.5,44.5 116.97,42.97 K1.2 | IC5.9 100,92.4 100,106.4 101.6,108 | 101.6,108 102.69,109.09 D7.K | U$1.1 65.57,106.47 | R3.2 66.37,107.27 | 65.57,106.47 66.37,107.27 | C1.+ 68.13,106.47 67.1,106.47 | 67.1,106.47 65.57,106.47 | 66.37,107.27 66.37,107.2 67.1,106.47 | C1.+ 71,107.8 v82.3,107.8 | v88.4,108.1 89.6,108.1 90.59,109.09 100.9,109.09 | 100.9,109.09 D7.K | 100.9,109.09 101.6,108.39 101.6,108 | C13.1 C1.+ | C4.1 57.7,75.89 59.1,74.5 IC2.1 65,74.5 D9.K
  Bottom 1.016: IC1.3 69.91,36.86 C2.+ 68.25,32.45 C11.1
  Bottom 1.27: K1.2 110.26,42.97 D6.K | K5.2 110.43,113.47 107.26,110.3 D7.K | K3.2 111.01,77.97 107.47,74.43 D4.K | K2.2 114.29,60.69 108.2,60.69 107.2,59.69 D5.K
  other vias: 65.4,74.89 107.2,55.69
+24V
  Bottom 0.813: 47.4,85.6 48.6,85.6 R34.2 51.21,85.68 R21.1 | 45.6,85.6 47.4,85.6 | 47.4,85.6 46.2,86.8 | 47.4,85.6 46.8,85
  Bottom 1.016: D11.C 22.5,114.3
  Bottom 1.27: 56.15,30.15 B4.+1 52.36,32.64 58.2,26.8 60,26.8 | 56.15,30.15 59.11,27.2 R5.1 | 56.15,30.15 56.15,30.78 56.41,31.04 56.41,33.4
  Bottom 2.54: R8.2 23.3,113.9 23.7,114.3
  pour Bottom (isolate 0.5, no thermals): 1.5,55 1.5,47 3,45.5 44.5,45.5 47,43 47,33 49,31 56,31 57,32 57,50.5 52.5,55
  pour Bottom (isolate 0.5, no thermals): 21.5,120.3 23.5,120.3 23.5,115.5 29,115.5 30,116.5 30,122.6 30.9,123.5 53.5,123.5 54.5,122.5 54.5,118 54,117.5 52,117.5 51.5,118 51.5,121 32,121 32,114.9 29.9,112.8 21.92,112.8 21.58,113.37
  pour Bottom (isolate 0.5, rank 2, no thermals): 32,48.5 32,122 33.5,123.5 53.5,123.5 54.5,122.5 54.5,117 54,116.5 52,116.5 51.5,117 51.5,120 51,120.5 47,120.5 47,48.5
AC_ADC
  Bottom 0.6: 103.4,47.9 103.4,47.4 103.4,33.8 105,32.2 105,9.18 105.2,9.4 105,9.2 GC3.TP
  Bottom 0.61: 103.4,47.4 103.4,55.3 97.6,61.1 79.1,61.1 76.2,64 76.2,72.2 78.3,74.3 81.7,74.3 82.81,75.41 IC7.24 | GC3.TP 105.2,9.2 108.3,9.2
  Bottom 0.813: R12.1 108.6,9.5 108.3,9.2 Z1.K 108.1,7 C25.1 R11.2
  Bottom 1.27: R12.1 C24.1
CURRENT_ADC  (via drill 0.35)
  Top 0.61: v39.5,103 31.63,103 C20.1
  Bottom 0.508: C20.1 31.53,103.97 31,104.5 25.45,104.5 C21.+ 24.75,103.81 IC8.7
  Bottom 0.61: IC7.26 79.71,82.01 76.4,78.7 69.7,78.7 68.7,79.7 | 68.7,79.7 68.6,79.8 68.6,79.7 | 68.7,79.7 68.7,79.9 | 68.7,79.9 68.7,95.5 66.2,98 51,98 46,103 v39.5,103 | GC7.TP 66.5,79.7 68.5,79.7 | 68.7,79.7 68.5,79.7 | 68.7,79.9 68.5,79.7
  Bottom 0.635: C20.1 31.05,102.63
  other vias: 31.53,103.1
D4  (1 unrouted)
  Bottom 0.508: IC7.2 83.61,89.39 82.3,90.7 81,90.7 79.8,91.9 79.8,95.2 80.8,96.2 90.8,96.2 91.8,95.2 91.8,88.7 92.25,88.25 93.8,88.25
D5
  Bottom 0.6: IC5.4 94.03,86.81 IC7.9
D6
  Bottom 0.6: IC5.3 93.89,86.01 IC7.10
D7
  Bottom 0.6: IC7.11 91.99,85.21 92.76,84.44 IC5.2
D8
  Bottom 0.6: IC7.12 91.29,84.41 92.53,83.17 IC5.1
DC_ADC
  Bottom 0.61: IC7.25 80.61,81.21 76.9,77.5 63.3,77.5 60.6,80.2 60.6,83.8 58.52,85.88 56.4,85.88
  Bottom 0.813: C23.1 C22.1 54.27,88.94 R23.1 54.26,85.92 R21.2 56.4,85.88 56.62,85.88 GC4.TP
GND  (via drill 0.35)  (2 unrouted)
  Top 0.406: 47.6,111.9 65.8,111.9 | 47.6,111.9 46.5,111.9 45.9,111.9 45.1,111.1 44.8,111.4 46.4,113 47.4,112 | 47.6,111.9 46.6,110.9 46.3,110.9 | 66.6,112.4 66.35,112.15 66.1,111.9 | 66.1,111.9 65.8,111.9 | 66.1,111.9 66.6,111.9 | 65.8,111.9 66.6,112.7 | R14.2 69.21,120.2 v71.8,120.2 | v92.4,121.2 139,121.2 141.5,118.7 R16.2
  Top 0.61: 70.15,108.35 66.6,111.9 66.6,112.4 66.6,112.7 66.6,117.59
  Top 0.813: 20.5,90.5 20,90.5 | C21.- 21.16,106.16 20.5,105.5 20.5,92.5 | 20.5,92.5 18,90 | 20.5,92.5 21.5,91.5 | 46.5,111.9 66.6,111.9 66.6,117.59 R14.2 | 70.4,104.7 70.4,108.1 70.15,108.35 66.35,112.15 | C1.- 69.2,103.5 70.4,104.7 | 70.4,104.7 72.4,104.7 73.3,103.8 73.3,90.47 SERIAL_OUT_4PIN.1 | R34.1 47.4,89.25 | 47.4,89.25 46.25,89.25 46.2,89.2 | 47.4,89.25 46.25,90.4 46.2,90.4 | 47.4,89.25 47.4,89.2 46.2,88 | C25.2 109.5,4.6 63,4.6 62.1,5.5 60.6,7
  Top 2.54: B4.- 38.57,14.63 46.2,7 59.4,7 60.6,7 64.25,10.65 U$3.IN-
  Bottom 0.406: 85.21,86.01 84.31,86.9 82.64,86.9 80.35,89.19 73.31,89.19 72.92,89.59 SERIAL_OUT_4PIN.1 72.72,89.29 | 76.22,95.61 77.7,97.1 | v71.8,120.2 72.9,121.3 92.3,121.3 v92.4,121.2
  Bottom 0.508: C9.2 84.84,66.15 85.39,65.6 | 90.3,64.6 C28.1 | IC8.5 24.72,106.35 C21.- | C20.2 31.5,105.92
  Bottom 0.6: 32.09,105.9 C20.2 29.5,105.9 27.5,105.9 27.19,105.9 C18.2 28.5,105.92 28.93,106.35 | IC7.5 86.01,86.81 85.7,86.5 84.9,86.5 84.41,86.99 IC7.3 | C30.1 IC7.21
  Bottom 0.61: C29.1 94.47,65.3 LED_CONNECTOR.1 92.27,64.6 90.3,64.6 | C28.1 86.39,64.6 85.39,65.6 | 51.47,88.94 R23.2 | 85.21,86.01 IC7.21 | 85.7,86.5 85.21,86.01 | 85.21,86.01 84.41,86.81 84.41,86.99 | IC5.8 94.1,92.15 94.1,94.2 91.2,97.1 77.7,97.1 72.42,91.81 SERIAL_OUT_4PIN.1
  Bottom 0.635: 28.93,106.35 C15.2
  Bottom 0.8: C15.2 29.11,106.16 | C30.1 85.2,74.24 C34.- 84.94,74.04 C36.2 84.94,69.61 C9.2
  Bottom 0.813: R12.2 111.4,9.5 Z1.A 111.9,7 C25.2 | C21.- 27.24,106.16 27.5,105.9 | C18.2 29.48,105.92 29.5,105.9 | U$1.4 64.51,102.66 65.8,101.38 R4.2 68.28,101.38 68.9,102 C1.- 69.49,102.91 C13.2 | 51.47,88.94 51.16,89.25 51.47,89.55 C22.2 C23.2 | R23.2 51.14,89.25 R34.1 | C4.2 53.66,75.94 IC2.4 54.61,71.27 C17.2
  Bottom 1: C15.2 31.5,105.92 | IC2.4 52.43,70.98
  Bottom 1.016: 64.25,18.4 D8.A 65.45,18.4 | 65.45,18.4 64.25,19.6 | 65.45,18.4 64.25,17.2 | HS2.1 79.2,40.6 77.7,39.1 | HS2.2 79.2,37.6 77.7,39.1 | 77.7,39.1 77.1,39.7 76.8,39.4 IC1.2 64.8,39.4 | 64.8,39.4 64.25,39.4 | 64.95,39.55 64.95,40 64.95,41 C3.- | 64.95,39.55 64.8,39.4 | 64.95,39.55 64.95,38 C2.- 64.95,32.45 C11.2
  Bottom 1.27: 112.1,13.8 R22.1 117.35,13.8 C7.- 118.62,12.77 B3.- | 112.1,13.8 111.4,13.1 R12.2 C24.2 112.1,13.8 | R23.2 51.37,88.85 | U$3.IN- 64.25,17.2 64.25,18.4 64.25,19.6 64.25,39.4 U$3.OUT- 54.91,60.84 C16.2 54.45,63.02 C10.- 54.61,64.96 C17.2 | 64.95,40 65.55,39.4 | IC1.2 65.55,39.4 | 65.55,39.4 65.55,38.6 64.95,38 | 65.55,39.4 65.55,40.4 64.95,41
  other vias: 141.5,114.4 48.69,89.25 111.4,14.5 111.4,6.5
  pour Top (isolate 0.5, no thermals): 13,92 26,92 47,71 47,44 29.78,43.72 28.5,40.5 28.5,26 30.5,24 42.5,24 42.5,12 22,12 13,21
  pour Top (isolate 0.5, rank 2, no thermals): 1,57.5 2.5,56 27.5,56 27.5,90 25.5,92 1.5,92 1,91.5
  pour Top (isolate 0.5, rank 2, no thermals): 38.5,120.5 47,120.5 47,66 45,64 12,64 12.5,79.5 38.5,105.5
LEDAC_K
  Bottom 1.016: J1.2 148.75,99.25 149.72,98.28 149.72,83.78 D1.A
  Bottom 1.27: R26.2 150.07,82.62 D1.A 149.31,84.68 L9.K
LIVE  (via drill 0.35)
  Bottom 0.6: 120.95,21.25 120.9,21.3 109.9,21.3 109.1,22.1
  Bottom 0.813: R18.1 131.2,16.5 124.8,16.5 | 124,15.7 124.8,16.5 | 124.8,16.5 123.2,16.5 122.85,16.85
  Bottom 1.27: 120.5,18 121.7,18 122.85,16.85 124,15.7 124,6.5 128,2.5 145.5,2.5 150,7 150,76.22 R26.1
  Bottom 2.54: K1.P 119,37 121,35 121,22.5
  Bottom 3: 121,24.9 118.2,22.1 109.1,22.1 F1.2
  other vias: 112.8,25.6 114.8,25.6 116.8,25.6 118.8,25.6 120.8,25.6 112.8,23.6 114.8,23.6 116.8,23.6 118.8,23.6 120.8,23.6 112.8,21.6 114.8,21.6 116.8,21.6 118.8,21.6 120.8,21.6 112.8,19.6 114.8,19.6 116.8,19.6 118.8,19.6 120.8,19.6
  pour Bottom (isolate 1, no thermals): 106.5,26.7 106.5,17.8 106.9,17.4 121.9,17.4 122.2,17.7 122.2,25.6 120.4,27.4 107.2,27.4
  pour Top (isolate 0.5, no thermals): 111.2,36 111.6,35.6 118.4,35.6 119.6,34.4 119.6,28 106.8,28 106.4,27.6 106.4,17.6 107.2,16.8 121.6,16.8 122.8,18 122.8,19.2 122.4,19.6 122.4,35.2 119.2,38.4 112.4,38.4 111.6,38.4 111.2,38
LOW_BUS_LED  (via drill 0.35)
  Top 0.61: v94.3,113.7 95,113 v95,81.6
  Bottom 0.61: IC7.14 91.59,82.81 92.9,81.5 94.9,81.5 v95,81.6 | v94.3,113.7 94.3,114 98.2,117.9 132.7,117.9 136.6,114 136.6,105.9 140.75,101.75 J1.3
MISO
  Bottom 0.6: IC7.16 90.7,80.41 90.7,76.3 91.7,75.3 LED_CONNECTOR.5
MOSI  (via drill 0.35)
  Top 0.61: v92,116.3 92,82 v94.9,79.1
  Bottom 0.6: IC7.15 90.79,82.01 92.9,79.9 92.9,77.87 LED_CONNECTOR.6
  Bottom 0.61: J1.7 147.3,111.75 148.4,112.85 148.4,116.1 144.4,120.1 96.4,120.1 92.6,116.3 v92,116.3 | v94.9,79.1 94,79.1 | 94,79.1 93.7,79.1 | 93.7,79.1 93.2,79.1 92.97,78.87 LED_CONNECTOR.6 | 92.9,79.9 93.7,79.1 | 93.7,79.1 92.97,78.37 LED_CONNECTOR.6 | 94,79.1 92.97,78.07 LED_CONNECTOR.6
MOTOR_OUT
  Top 0.813: 57.64,117.96 56.84,117.96 56.1,118.7 | R13.1 57.66,117.96 | 57.66,117.96 57.64,117.96 | 57.64,117.96 56.7,118.9 | 57.66,117.96 56.9,117.2 56.8,117.2
  Bottom 0.813: C5.2 55.73,102.83 C6.- 56.83,103.93 U$1.6 61.13,103.93 61.4,104.2 61.4,106.5 59.6,108.3 59.6,116.1 56.7,119 Q1.SOURCE
  pour Top (isolate 0.5, no thermals): 36,123 36,117.5 36.5,117 38,117 38.5,117.5 38.5,120 39.5,121 54,121 54.5,120.5 54.5,117 55,116.5 57,116.5 57.5,117 57.5,123 57,123.5 36.5,123.5
  pour Bottom (isolate 0.5, no thermals): 35.9,120.38 35.9,116.9 31,112 18,112 18,104.5 15.5,104.5 15,104 15,102.5 15.5,102 20.5,102 21,102.5 21,109.5 32.5,109.5 38.5,115.5 38.45,120.4
MOTORADC  (via drill 0.35)
  Top 0.406: R14.1 64.11,120.01 65.7,121.6 73.2,121.6 74.3,120.5 74.3,84.6 76.8,82.1 v78,82.1 78.3,82.1
  Top 0.61: R14.1 61.81,117.9 R13.2
  Bottom 0.406: v78,82.1 78.71,82.81 IC7.27
N$1  (via drill 0.35)
  Top 0.61: v60,105.3 60,107 58.5,108.5 v53.2,108.5
  Bottom 0.61: U$1.7 59.9,105.2 v60,105.3
  Bottom 0.813: VD1.A 51.63,110.6 R1.2 54.3,109.6 v53.2,108.5
N$2  (via drill 0.35)
  Top 0.813: R2.2 30.9,108.13 VD2.A 34.82,107.5 v40,107.5
  Bottom 0.813: v40,107.5 45.1,107.5 51.9,100.7 57.47,100.7 58.43,101.66 U$1.5
N$3
  Top 0.813: R2.1 33.44,111.81 VD2.C 35.26,113.64 R15.2 34.5,115.9 Q2.GAET
N$4
  Bottom 1.016: R6.1 95,9.4 95,12.66 Q4.C 94.2,13.46 94.2,21.1 88.1,27.2 R5.2
  Bottom 1.27: R5.2 76,27.2 73.8,25 73.8,14.04 U$3.VIN+
N$5
  pour Bottom (isolate 0.5, no thermals): 2,27.5 2,16.5 14.5,4 53,4 57.5,8.5 57.5,24 56,25.5 46.5,25.5 44,23 44,16 42.5,14.5 25.5,14.5 19,21 19,26 17.5,27.5
N$6
  Top 0.813: Q1.GAET 50.5,117 51,116.5 51.97,116.5 R32.1
  Bottom 0.813: Q1.GAET 49.5,118 49.5,114.71 VD1.C 50.81,113.4 R1.1
N$7
  Bottom 2: J4.3 136,31.5 131.3,26.8 F1.1
  pour Top (isolate 0.5, no thermals): 132.4,23.2 132.4,22 131.6,21.2 130.8,21.2 130.4,21.6 130.4,27.2 135.6,32.4 139.2,32.4 139.2,33.6 139.6,34 144,34 144.4,33.6 144.4,30 144,29.6 139.6,29.6 139.2,30 139.2,30.4 136.4,30.4 132.4,26.4
N$8
  Bottom 0.813: C5.1 53.89,105.7 C6.+ 57.17,106.47 U$1.8 58.43,108.47 D2.K
N$9
  Bottom 0.813: R3.1 61.66,109.04 D2.A
N$10  (via drill 0.35)
  Top 0.406: v29.35,101.52 23.98,101.52 22.49,103.01 IC8.6
  Bottom 0.152: IC8.6 23.02,105.08
  Bottom 0.61: C15.1 v29.35,101.52
  other vias: 22.49,105.08
N$11
  pour Bottom (isolate 0.5, no thermals): 3.5,41 1,38.5 1,31 3,29 27,29 31.5,33.5 40.5,33.5 43,36 43,42.5 41.5,44 20,44 17,41
N$12
  Bottom 3: J6.1 129.57,40.1 K1.O
  pour Top (isolate 0.5, rank 2, no thermals): 125.2,42.4 129.2,38.4 143.6,38.4 144.8,39.6 144.8,40.4 143.6,41.6 142.4,41.6 130.4,41.6 127.2,44.8 126,44.8 125.2,44
N$13
  Bottom 2.54: K2.P 117.5,54.5 121.5,50.5 121.5,39.73 126.7,34.53 K1.S
  pour Top (isolate 0.5, no thermals): 125.6,30.4 125.6,33.6 120.4,38.8 120.4,50 117.2,53.2 112,53.2 111.2,54 111.2,55.2 112,56 118,56 122.8,51.2 122.8,40.4 128,35.2 128,30.8 128,30.4 127.6,30 127.2,29.6 126,29.6 125.6,30
N$14
  Bottom 2.54: K2.O 126.7,55.8 137.5,45 143.1,45 J6.2
  pour Top (isolate 0.8, rank 2, no thermals): 144.4,44.4 143.6,43.6 137.2,43.6 125.2,55.6 125.2,60.8 126.4,62 127.2,62 128,61.2 128,56.4 138,46.4 142.4,46.4 144,46.4 144.4,46 144.8,45.6 144.8,44.8
N$15
  Bottom 2.54: K3.P 119.5,72 121.5,70 121.5,56 126.7,50.8 K2.S
  pour Top (isolate 0.8, rank 2, no thermals): 125.6,48 125.6,50 120.4,55.2 120.4,69.2 118.8,70.8 111.6,70.8 110.8,71.6 110.8,72.4 111.6,73.2 120,73.2 122.8,70.4 122.8,56.4 128,51.2 128,48 127.2,47.2 126.8,47.2 126.4,47.2
N$16
  Bottom 2.54: K4.P 118.5,89.5 121,87 121,77.5 126.7,71.8 K3.S
  pour Top (isolate 0.5, rank 2, no thermals): 125.6,65.6 125.6,71.2 120,76.8 120,86 118,88 117.6,88.4 112.4,88.4 112,88.4 111.6,88.8 111.2,89.2 111.2,89.6 111.2,90 111.6,90.4 112,90.8 118.8,90.8 119.2,90.8 122,88 122.4,87.6 122.4,78 128,72.4 128,65.6 127.2,64.8 126.8,64.8 126.4,64.8 126,64.8 125.6,65.2
N$17
  Bottom 2.54: K3.O 129.53,77.97 130.5,77 130.5,57.5 137.74,50.26 J6.3
  pour Top (isolate 0.8, rank 2, no thermals): 143.2,51.6 138.4,51.6 132,58 131.6,58.4 131.6,77.2 131.6,77.6 130,79.2 126,79.2 125.6,78.8 125.6,77.2 126,76.8 128.8,76.8 129.2,76.4 129.2,58 129.2,57.2 130,56.4 137.2,49.2 143.6,49.2 144,49.2 144.8,50 144.8,50.8 144.4,51.2 144,51.6
N$18
  Bottom 2.54: J6.4 137.78,55.34 133.5,59.62 133.5,90.67 128.7,95.47 K4.O
  pour Top (isolate 0.6, rank 2, no thermals): 138,54 143.6,54 144.8,55.2 144.8,55.6 144,56.4 143.6,56.8 138.4,56.8 134.8,60.4 134.8,91.6 130.8,95.6 129.6,96.8 126.4,96.8 125.6,96 125.6,95.6 125.6,94.8 126,94.4 128.4,94.4 132.4,90.4 132.4,59.6 132.4,59.2 137.2,54.4 137.6,54
N$20
  Bottom 0.508: IC5.14 100.44,85.61 | 109.91,66.03 K3.1
  Bottom 0.61: IC5.14 98.61,85.71 97.9,85 97.9,73.1 102.09,68.91 D4.A
  Bottom 1.27: D4.A 107.47,68.57 110.01,66.03 K3.1
N$21
  Bottom 1.016: IC1.1 69.91,41.94 C3.+ 68,43.85 C12.1 67.8,46.2 67.8,47.2 69,48.4 83.4,48.4 84.6,47.2 84.6,34 86.4,32.2 92.4,32.2 96,28.6 96,16 97.34,14.66 Q4.E
N$22  (1 unrouted)
  Bottom 0.508: IC5.12 97.35,88.25 96.3,87.2 96.3,71.7 104.6,63.4 104.6,35.9 106,34.5 107.5,34.5
  Bottom 0.813: D6.A 107.31,33.2 109.47,31.03 K1.1
N$23
  Bottom 0.61: J1.4 149.65,104.25 R7.1
N$24
  Bottom 1.016: D8.C 79.55,15.65 82.8,12.4 91.8,12.4 Q4.B 91.66,12.86 91,12.2 91,9.4 R6.2
N$25
  Bottom 0.508: IC5.13 97.74,86.98 96.96,86.2 96.96,72.54 105.71,63.79 105.71,51.83 109.01,48.53
  Bottom 1.27: K2.1 109.01,48.53 107.35,50.19 D5.A
N$28
  Bottom 0.6: IC7.7 87.61,90.79 85.35,93.05 Q3.2
N$29
  Bottom 2.54: K5.P 118,107.5 120,105.5 120,93 126.7,86.3 K4.S
  pour Top (isolate 0.8, rank 2, no thermals): 111.2,108 112,108.8 118.4,108.8 121.2,106 121.2,93.6 121.6,93.2 128,86.8 128,83.2 127.2,82.4 126,82.4 125.6,82.8 125.6,85.6 118.8,92.4 118.8,92.8 118.8,105.2 117.6,106.4 112,106.4 111.6,106.8 111.2,107.2
N$30
  Bottom 2.54: K5.O 123,109.77 123,99.83 124.33,98.5 132,98.5 136.69,93.81 136.69,64.31 140.58,60.42 J6.5
  pour Top (isolate 0.6, rank 2, no thermals): 140,59.2 144,59.2 144.4,59.6 144.4,61.2 144,61.6 141.2,61.6 138,64.8 138,94.4 133.2,99.2 132.8,99.6 125.6,99.6 124.8,99.6 124,100.4 124,109.2 127.2,112.4 128,113.2 128,114 127.2,114.8 126.8,114.8 126,114.8 122,110.8 122,99.2 123.6,97.6 124,97.2 131.6,97.2 135.6,93.2 135.6,64.4 135.6,63.6 139.6,59.6
N$31
  Bottom 2.54: K5.S 134.47,101.53 140,96 140,67 141.5,65.5 J6.6
  pour Top (isolate 0.5, rank 2, no thermals): 144,66.8 142.4,66.8 142,66.8 141.2,67.6 141.2,96.4 135.2,102.4 134.8,102.8 126.4,102.8 126,102.8 125.6,102.4 125.2,102 125.2,101.2 126,100.4 133.6,100.4 134,100.4 138.8,95.6 138.8,66.8 141.2,64.4 144,64.4 144.8,65.2 144.8,65.6 144.8,66
N$32
  Bottom 0.813: B3.AC1 129.8,6.93 R24.1
N$34
  Bottom 0.508: IC5.15 99.04,84.44 98.8,84.2 98.8,81.7 99.8,80.7 108.7,80.7 111.53,83.53 K4.1
  Bottom 1.016: K4.1 111.01,83.53 107.67,86.86 D3.A
N$36
  Bottom 0.6: IC7.8 88.41,92.83 Q3.1
N$37
  Bottom 0.508: IC5.16 100.38,83.2
  Bottom 0.61: 100.44,83.07 IC5.16 102.77,83.17 104.4,84.8 104.4,99.1 106.83,101.53 K5.1
  Bottom 1.27: K5.1 109.01,101.53 107.26,103.28 D7.A
N$38
  Bottom 0.813: B3.AC2 127.73,14 R18.2
N$40
  Bottom 1.27: R11.1 112.3,3.5 115,6.2 R22.2 117.35,8.2 C7.+ 119.38,10.23 B3.+
N$47
  pour Bottom (isolate 0.5, no thermals): 15.5,105 17.5,105 17.5,107 17,107.5 12,107.5 11.5,107 11.5,96 12.5,95 18.5,95 19,95.5 19,101.5 15,101.5 14.5,102 14.5,104
  pour Top (no thermals): 1.6,104.2 1.6,94.9 2.3,94.2 18.5,94.2 19,94.7 19,104.6 2,104.6
N$50
  Bottom 0.61: J1.8 144.45,114.25 R16.1
OVRL
  Bottom 0.61: J1.5 144.35,106.75 142.97,108.13 142.97,117.63 141.69,118.91 97.31,118.91 69.8,91.4 69.8,80.8 70.9,79.7 73.7,79.7 77.61,83.61 IC7.28
PE  (via drill 0.35, 3.3 pad 6)
  other vias: 144,18.4 142,18.8 140,18.8 138.8,17.2 138.8,15.2 140.4,14 143.2,13.6 145.2,13.6 141.6,11.6 143.2,11.6 143,8 140,11.6 138.4,11.6 138.4,10 138.4,13.2 138.4,8.4 138.4,7.2 144.8,11.6 146,10.4 140,10 140,7.2 140,8.4
  pour Bottom (no thermals): 138,18.5 139,19.5 144.6,19.5 146,18.1 146,8.1 144.6,6.7 138,6.7
  pour Top (isolate 0.8, rank 2, no thermals): 138.8,20 137.6,18.8 137.6,12 137.6,8 139.2,6.4 143.6,6.4 146.4,9.2 146.4,18.4 144.8,20
POT_ADC
  Bottom 0.508: IC7.23 83.61,75.01 82.14,73.54 82.14,72.2 | 82.14,72.2 C36.1 | 82.14,72.2 82.04,72.1 C9.1 82.04,66.45 J9.2
  Bottom 0.61: C9.1 80.59,69.51 GC8.TP
  Bottom 0.8: 81.72,69.83 C9.1
PWM  (via drill 0.35)
  Top 0.406: v76.7,101.1 77.7,100.1 GC5.TP
  Bottom 0.406: IC7.1 82.81,88.89 81.8,89.9 80,89.9 77.7,92.2 GC5.TP | U$1.2 62.7,105.2 62.2,104.7 62.2,101.5 64.3,99.4 75,99.4 v76.7,101.1
RST  (via drill 0.35)
  Top 0.406: v83.7,84.4 87.4,84.4 89.8,82 89.8,71.9 91.4,70.3 LED_CONNECTOR.3
  Bottom 0.406: IC7.29 v83.69,84.41 v83.7,84.4
  Bottom 0.61: LED_CONNECTOR.3 91.9,70.3 R53.1
  Bottom 0.8: C29.2 94.67,70.3 LED_CONNECTOR.3
RXD
  Bottom 0.508: SERIAL_OUT_4PIN.3 73.03,85.21 IC7.30
SCK  (via drill 0.35)
  Top 0.61: v93.65,119.45 97.4,115.7 97.4,75.2 95,72.8 LED_CONNECTOR.4
  Bottom 0.6: IC7.17 89.7,78.42 89.7,74.4 91.3,72.8 LED_CONNECTOR.4
  Bottom 0.61: v93.65,119.45 95.3,121.1 145.5,121.1 149.56,117.04 149.56,110.71 148.1,109.25 J1.6
SD_PIN  (via drill 0.35)
  Top 0.406: 75.5,89.8 75.2,90.1 | 65.9,104 66.08,104.17 v66.19,104.17
  Top 0.61: v66.19,104.17 66.19,101 67,100.2 v71.7,100.2 | v75.3,103 75.3,90 75.5,89.8 GC6.TP
  Bottom 0.61: v75.3,103 75.3,102.6 72.9,100.2 v71.7,100.2 | IC7.32 78.49,86.81 GC6.TP
  Bottom 0.813: v66.19,104.17 65.95,103.93 U$1.3
SOLAR_IN  (via drill 0.35)
  Top 0.508: D11.A2 25.04,111.46 26.1,110.4 39.6,110.4 v40,110
  Top 0.61: v58.3,113.9 59.8,115.4 v61.2,115.4
  Bottom 0.508: v40,110 41,109 v47.5,109
  Bottom 0.61: v47.5,109 47.5,110.4 49,111.9 56.3,111.9 v58.3,113.9 | v61.2,115.4 61.2,120.4 63.3,122.5 146.1,122.5 150.4,118.2 150.4,107.8 R7.2
  Bottom 0.813: R8.1 17.2,114.8 v17.2,117.6
  other vias: 2.8,121.6 4.8,121.6 6.8,121.6 8.8,121.6 10.8,121.6 13.2,121.6 15.2,121.6 17.2,121.6 19.2,121.6 21.2,122 23.2,122 25.2,122 27.2,121.2 27.2,119.2 27.6,117.2 17.2,119.6 15.2,119.6 15.2,117.6 13.2,119.6 13.2,117.6 10.8,119.6 10.8,117.6 8.8,119.6 6.8,119.6 8.8,117.6 4.8,119.6 2.8,119.6 6.8,117.6 4.8,117.6 2.8,117.6 2.8,115.6 4.8,115.6 6.8,115.6 8.8,115.6 9.2,113.6 7.2,113.6 5.2,113.6 3.2,113.6
  pour Bottom (isolate 0.5, no thermals): 1.5,75 18,75 18,85 10.24,85 10.7,116 21,116 21,120.5 21.5,121 23.5,121 24,120.5 24,116 28,116 29,117 29,123.5 1.5,123.5 0.5,122.5 0.5,76
  pour Top (isolate 0.5, rank 2, no thermals): 10.8,116 10.8,106.8 10.4,106.4 1.6,106.4 1.2,106.8 1.2,122.4 1.6,122.8 28.8,122.8 28.8,116.8 28,116 24,116 24,120.8 23.6,121.2 21.2,121.2 20.8,120.8 20.8,116
TXD
  Bottom 0.508: IC7.31 73.5,86.01 SERIAL_OUT_4PIN.2
VSS
  Bottom 0.813: R24.2 134.2,8.5 136,10.3 136,21.95 137.93,23.88 J4.2
  Bottom 1.016: J1.1 145.95,96.75 143.81,94.61 143.81,87.2 | 143.81,87.2 143.81,86.21 | L9.A 144.91,86.11 143.81,87.2
  Bottom 1.27: J6.8 143.78,76.16 143.78,83.35 D1.K 143.81,84.61 | 143.81,84.61 143.81,86.21 | 143.81,84.61 L9.A
  Bottom 2.54: J4.2 144.38,23.88 147,26.5 147,72 143.34,75.66 J6.8 J6.7
  pour Top (isolate 0.8, rank 2, no thermals): 139.2,25.2 139.2,22.4 144.4,22.4 144.8,22.4 148.4,26 148.4,72.4 144.8,76 144.8,76.4 144,77.2 142,77.2 141.6,76.8 141.6,75.2 141.6,74.8 142,74.4 142,70 142.4,69.6 142.8,69.2 144,69.2 144.8,70 144.8,72.4 145.6,71.6 145.6,26.8 144.8,26 140,26
(copper drawn outside any net)
  shapes: Bottom area x3

### Text on the board
tNames: Mains On